# Altium schematic sheet Connector.SchDoc
size A4; SheetNumber: 6; SheetTotal: 7
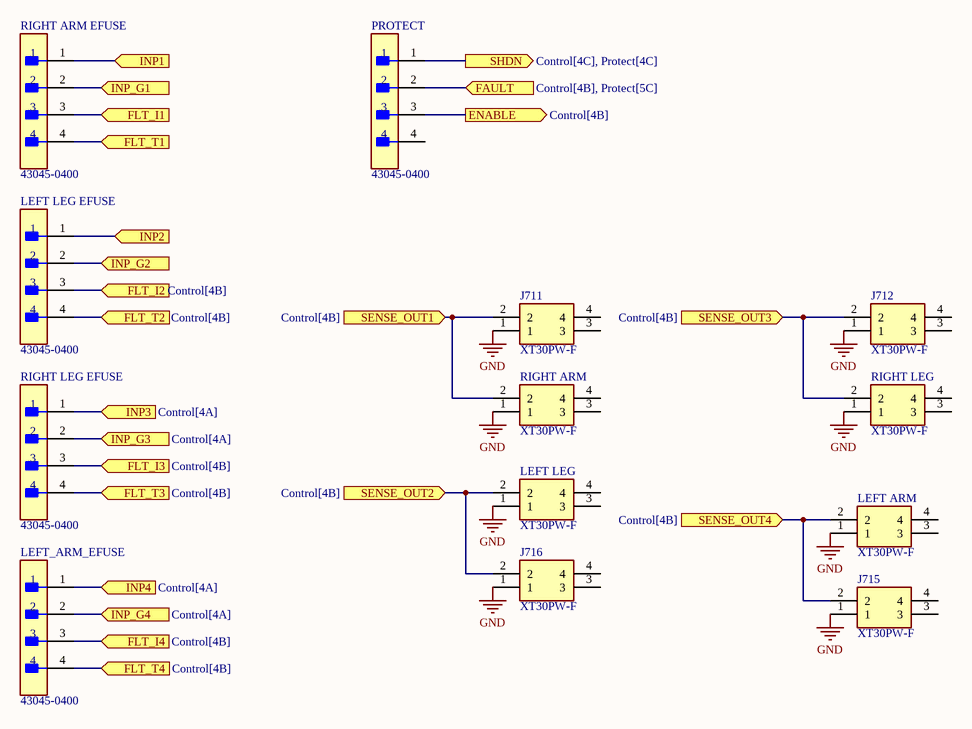
[diagram p0: Connector.SchDoc]

## Parts
J711  XT30PW-F  [XT30PWF]
J712  XT30PW-F  [XT30PWF]
J715  XT30PW-F  [XT30PWF]
J716  XT30PW-F  [XT30PWF]
LEFT_ARM  XT30PW-F  [XT30PWF]
LEFT_ARM_EFUSE  43045-0400  [FP-43045-0400-MFG]
LEFT_LEG  XT30PW-F  [XT30PWF]
LEFT_LEG_EFUSE  43045-0400  [FP-43045-0400-MFG]
PROTECT  43045-0400  [FP-43045-0400-MFG]
RIGHT_ARM  XT30PW-F  [XT30PWF]
RIGHT_ARM_EFUSE  43045-0400  [FP-43045-0400-MFG]
RIGHT_LEG  XT30PW-F  [XT30PWF]
RIGHT_LEG_EFUSE  43045-0400  [FP-43045-0400-MFG]

## Ports
ENABLE (out, see Control[4B]), FAULT (in, see Control[4B], Protect[5C]), FLT_I1 (in, see Control[4B]), FLT_I2 (in, see Control[4B]), FLT_I3 (in, see Control[4B]), FLT_I4 (in, see Control[4B]), FLT_T1 (in, see Control[4B]), FLT_T2 (in, see Control[4B]), FLT_T3 (in, see Control[4B]), FLT_T4 (in, see Control[4B]), INP1 (in, see Control[4A]), INP2 (in, see Control[4A]), INP3 (in, see Control[4A]), INP4 (in, see Control[4A]), INP_G1 (in, see Control[4A]), INP_G2 (in, see Control[4A]), INP_G3 (in, see Control[4A]), INP_G4 (in, see Control[4A]), SENSE_OUT1 (in, see Control[4B]), SENSE_OUT2 (in, see Control[4B]), SENSE_OUT3 (in, see Control[4B]), SENSE_OUT4 (in, see Control[4B]), SHDN (out, see Control[4C], Protect[4C])

## Nets
GND: J711.1 J712.1 J715.1 J716.1 LEFT_ARM.1 LEFT_LEG.1 RIGHT_ARM.1 RIGHT_LEG.1
ENABLE: PROTECT.3 ; port ENABLE
FAULT: PROTECT.2 ; port FAULT
FLT_I1: RIGHT_ARM_EFUSE.3 ; port FLT_I1
FLT_I2: LEFT_LEG_EFUSE.3 ; port FLT_I2
FLT_I3: RIGHT_LEG_EFUSE.3 ; port FLT_I3
FLT_I4: LEFT_ARM_EFUSE.3 ; port FLT_I4
FLT_T1: RIGHT_ARM_EFUSE.4 ; port FLT_T1
FLT_T2: LEFT_LEG_EFUSE.4 ; port FLT_T2
FLT_T3: RIGHT_LEG_EFUSE.4 ; port FLT_T3
FLT_T4: LEFT_ARM_EFUSE.4 ; port FLT_T4
INP1: RIGHT_ARM_EFUSE.1 ; port INP1
INP2: LEFT_LEG_EFUSE.1 ; port INP2
INP3: RIGHT_LEG_EFUSE.1 ; port INP3
INP4: LEFT_ARM_EFUSE.1 ; port INP4
INP_G1: RIGHT_ARM_EFUSE.2 ; port INP_G1
INP_G2: LEFT_LEG_EFUSE.2 ; port INP_G2
INP_G3: RIGHT_LEG_EFUSE.2 ; port INP_G3
INP_G4: LEFT_ARM_EFUSE.2 ; port INP_G4
SENSE_OUT1: J711.2 RIGHT_ARM.2 ; port SENSE_OUT1
SENSE_OUT2: J716.2 LEFT_LEG.2 ; port SENSE_OUT2
SENSE_OUT3: J712.2 RIGHT_LEG.2 ; port SENSE_OUT3
SENSE_OUT4: J715.2 LEFT_ARM.2 ; port SENSE_OUT4
SHDN: PROTECT.1 ; port SHDN

Not connected (* = marked no-connect by the designer): J711 3 4; J712 3 4; J715 3 4; J716 3 4; LEFT_ARM 3 4; LEFT_LEG 3 4; PROTECT 4; RIGHT_ARM 3 4; RIGHT_LEG 3 4

## Library data of the parts
J711 J712 J715 J716 LEFT_ARM LEFT_LEG RIGHT_ARM RIGHT_LEG = XT30PW-F: Connector; Manufacturer_Name: Amass; Datasheet Link: https://www.tme.eu/Document/ce4077e36b79046da520ca73227e15de/XT30PW%20SPEC.pdf; Height: 5mm; Manufacturer_Part_Number: XT30PW-F
LEFT_ARM_EFUSE LEFT_LEG_EFUSE PROTECT RIGHT_ARM_EFUSE RIGHT_LEG_EFUSE = CMP-04776-000002-1: CONN HEADER R/A 4POS 3MM; Manufacturer: Molex; Conn Gender: Male; Conn Orientation: Right Angle; Voltage Rating: 600V; Number Of Contacts: 4; Is Female: yes; Current Rating: 8.5A; ComponentLink2URL: https://www.molex.com/webdocs/datasheets/pdf/en-us/0430450400_PCB_HEADERS.pdf; Manufacturer Part Number: 43045-0400; Digikey Description: CONN HEADER R/A 4POS 3MM; Category: Conn; Temperature Range High: +105°C; Lead Free: Yes; Device Class L1: Connectors; Automotive: No; Temperature: -40°C to +105°C; Footprint Url: https://www.molex.com/pdm_docs/sd/430450400_sd.pdf; Height: 9.27mm; Number Of Rows: 2; Device Class L3: unset; Pitch: 3mm; Temperature Range Low: -40°C; Contact Material: Tin,Nickel; Octopart: https://octopart.com/43045-0400-molex-287063; RoHS: TRUE; ComponentLink2Description: Datasheet; Package: 43045-0400; Device Class L2: Headers and Wire Housings